# Altium schematic sheet Power-Section.SchDoc
size A4; SheetNumber: 2; SheetTotal: 8
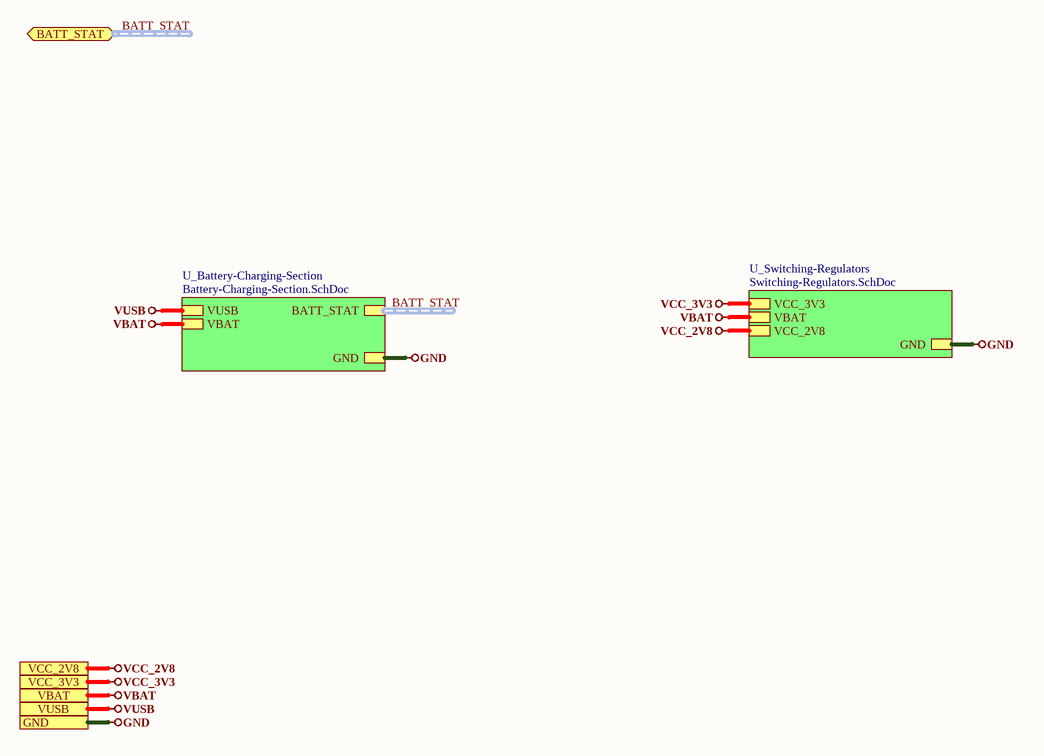
[diagram p0: Power-Section.SchDoc]

## Sub-sheets
U_Battery-Charging-Section = Battery-Charging-Section.SchDoc: BATT_STAT (harness BATT_STAT), VUSB, GND, VBAT
U_Switching-Regulators = Switching-Regulators.SchDoc: VCC_3V3, GND, VBAT, VCC_2V8

## Ports
BATT_STAT (bidir, harness BATT_STAT), GND, VBAT, VCC_2V8, VCC_3V3, VUSB

## Nets
GND: port GND, sheet U_Switching-Regulators/GND, sheet U_Battery-Charging-Section/GND
VBAT: port VBAT, sheet U_Switching-Regulators/VBAT, sheet U_Battery-Charging-Section/VBAT
VCC_2V8: port VCC_2V8, sheet U_Switching-Regulators/VCC_2V8
VCC_3V3: port VCC_3V3, sheet U_Switching-Regulators/VCC_3V3
VUSB: port VUSB, sheet U_Battery-Charging-Section/VUSB

## Buses and harness runs
harness BATT_STAT = port BATT_STAT
harness BATT_STAT = sheet U_Battery-Charging-Section/BATT_STAT

## Notes on the sheet
- 1
- Huzaifa Ali